# Altium project DiscreteOpAmp.PrjPcb
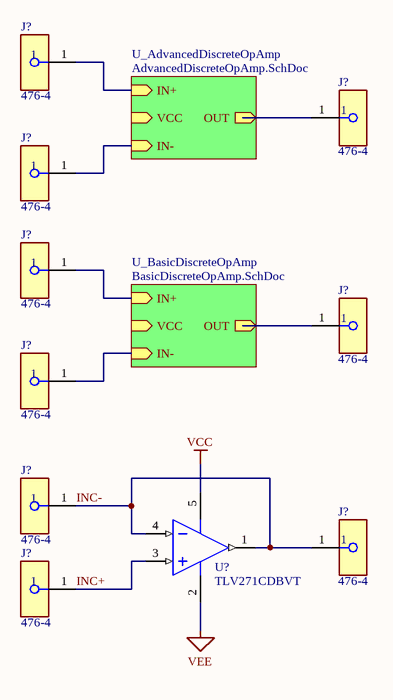
[diagram p0: main.SchDoc]
4 sheets, 40 parts. Net scope: hierarchical (ports join the sheet entries above them; power ports are global).
Board file: PCB1.PcbDoc
Sheets:
  main.SchDoc
    U_AdvancedDiscreteOpAmp = AdvancedDiscreteOpAmp.SchDoc
    U_BasicDiscreteOpAmp = BasicDiscreteOpAmp.SchDoc
  LM741_Design.SchDoc

## Sheet main.SchDoc
size A4; SheetNumber: 1; SheetTotal: 4

### Parts
(Parts that share a designator on the sheet are numbered #1, #2 ... from top to bottom, then left to right.)
J?#1  476-4  [FP-476-4-MFG]
J?#2  476-4  [FP-476-4-MFG]
J?#3  476-4  [FP-476-4-MFG]
J?#4  476-4  [FP-476-4-MFG]
J?#5  476-4  [FP-476-4-MFG]
J?#6  476-4  [FP-476-4-MFG]
J?#7  476-4  [FP-476-4-MFG]
J?#8  476-4  [FP-476-4-MFG]
J?#9  476-4  [FP-476-4-MFG]
U?  TLV271CDBVT  [DBV0005A_L]

### Sub-sheets
U_AdvancedDiscreteOpAmp = AdvancedDiscreteOpAmp.SchDoc: IN- (in), IN+ (in), OUT (out), VCC (in)
U_BasicDiscreteOpAmp = BasicDiscreteOpAmp.SchDoc: OUT (out), IN- (in), IN+ (in), VCC (in)

### Nets
VCC: U?.5(VDD)
VEE: U?.2(GND)
IN+: J?#1.1 ; sheet U_AdvancedDiscreteOpAmp/IN+
IN-: J?#6.1 ; sheet U_BasicDiscreteOpAmp/IN-
IN-: J?#3.1 ; sheet U_AdvancedDiscreteOpAmp/IN-  [a separate net that carries the same name]
INA+: J?#4.1 ; sheet U_BasicDiscreteOpAmp/IN+
INC+: J?#9.1 U?.3(IN+)
INC-: J?#7.1 J?#8.1 U?.1(OUT) U?.4(IN-)
OUT: J?#2.1 ; sheet U_AdvancedDiscreteOpAmp/OUT
OUTA: J?#5.1 ; sheet U_BasicDiscreteOpAmp/OUT

### Library data of the parts
J?#1-J?#9 = CMP-19636-000003-1: PLUG JACK MINI NON-INSULATED; Manufacturer: Keystone Electronics; Is Female: yes; Number Of Contacts: 1; Current Rating: 10A; Conn Orientation: Straight; Device Class L1: Connectors; Category: Conn; ComponentLink2Description: Datasheet; Lead Free: Yes; Device Class L3: unset; Package: 476-4; RoHS: TRUE; Contact Material: Tin; Footprint Url: https://www.keyelco.com/product-pdf.cfm?p=2378; Mouser Description: Test Plugs & Test Jacks BANANA JACK NON-INSUL; Octopart: https://octopart.com/476-4-keystone-225161; Device Class L2: unset; Manufacturer Part Number: 476-4; ComponentLink2URL: https://www.keyelco.com/userAssets/file/M65p111.pdf; Digikey Description: PLUG JACK MINI NON-INSULATED; Automotive: No
U? = CMP-0272-02196-3: 550 uA/Ch, 3 MHz, Rail-to-Rail Output Operational Amplifier, 2.7 to 16 V, 0 to 70 degC, 5-pin SOT23 (DBV5), Green (RoHS & no Sb/Br); Manufacturer: Texas Instruments; Total Supply Voltage(Max)(+5V is 5, +/-5V is 10): 16; GBW(Typ)(MHz): 3; Offset Drift(Typ)(uV/C): 2; Rating: Catalog; Vio (25C)(Max)(mV): 5; Slew Rate(Typ)(V/us): 2.4; IIB(Max)(pA): 60; Packing: SMALL T&R; Total Supply Voltage(Min)(+5V is 5, +/-5V is 10): 2.7; Sub Family: Low Supply Voltage Amplifier (<=2.7V), Precision Amplifier; Iq per channel(Max)(mA): 0.66; Number of Channels: 1; CMRR(Min)(dB): 69; ComponentLink3Description: Package Specification; Code_JEDEC: MO-178; ComponentLink1Description: Manufacturer URL; Eco-Plan: Green (RoHS & no Sb/Br); PackageReference: DBV0005A; Mounting Technology: Surface Mount; ComponentLink1URL: http://www.ti.com/; ComponentLink2URL: http://www.ti.com/lit/ds/symlink/tlv271.pdf; PackageDescription: 5-Pin Plastic Small Outline, Body 1.6 x 2.9 mm, Pitch 0.95 mm; DatasheetVersion: SLOS351D; ComponentLink2Description: Datasheet; PartNumber: TLV271CDBVT; ComponentLink3URL: http://www.ti.com/litv/pdf/mpds018i; PackageVersion: 4073253-4/K, 03/2006

## Sheet AdvancedDiscreteOpAmp.SchDoc
size A4; SheetNumber: 3; SheetTotal: 4
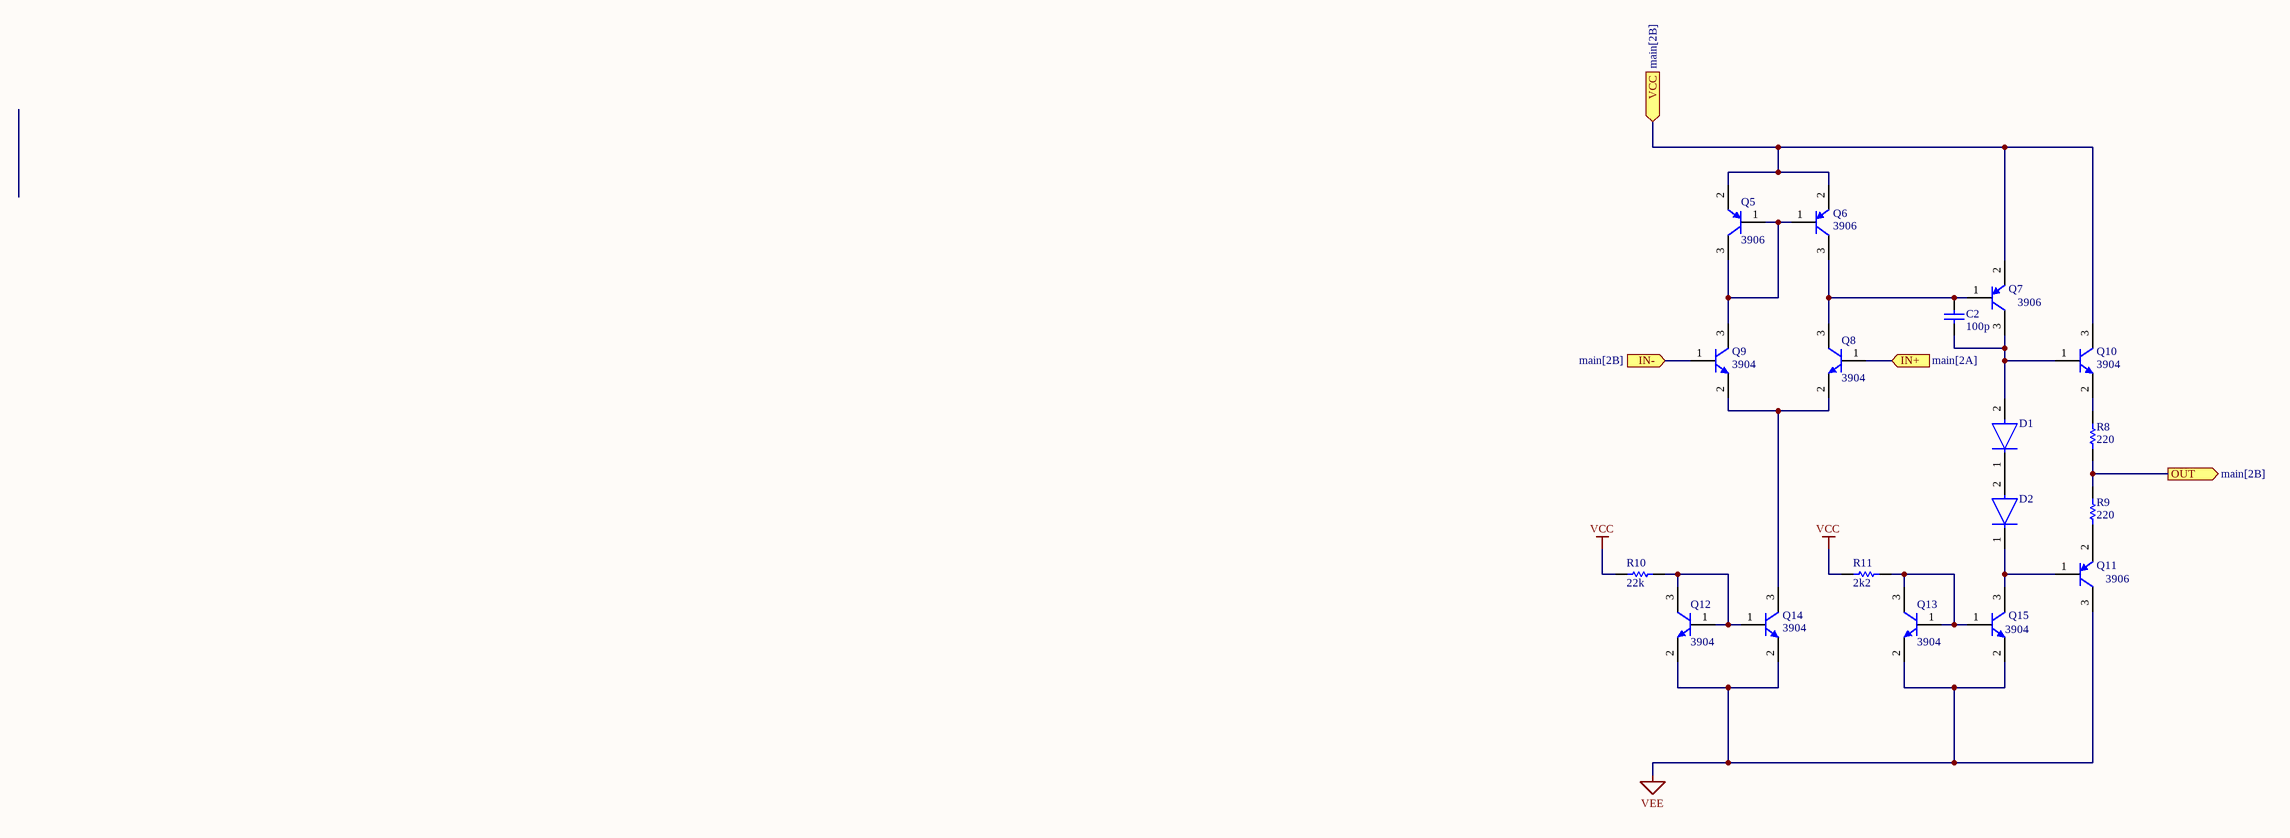
[diagram p1: AdvancedDiscreteOpAmp.SchDoc]

### Parts
C2  100p  [CAPC2013X145X48ML20T23]
D1  (no value)  [FP-96547-MFG]
D2  (no value)  [FP-96547-MFG]
Q5  3906  [ONSC-SOT-23-3-318-08_V]
Q6  3906  [ONSC-SOT-23-3-318-08_V]
Q7  3906  [ONSC-SOT-23-3-318-08_V]
Q8  3904  [ONSC-SOT-23-3-318-08_V]
Q9  3904  [ONSC-SOT-23-3-318-08_V]
Q10  3904  [ONSC-SOT-23-3-318-08_V]
Q11  3906  [ONSC-SOT-23-3-318-08_V]
Q12  3904  [ONSC-SOT-23-3-318-08_V]
Q13  3904  [ONSC-SOT-23-3-318-08_V]
Q14  3904  [ONSC-SOT-23-3-318-08_V]
Q15  3904  [ONSC-SOT-23-3-318-08_V]
R8  220  [RESC2013X50X30ML20T20]
R9  220  [RESC2013X50X30ML20T20]
R10  22k  [RESC2013X50X30ML20T20]
R11  2k2  [RESC2013X50X30ML20T20]

### Ports
IN+ (in, see main[2A]), IN- (in, see main[2B]), OUT (out, see main[2B]), VCC (in, see main[2B])

### Nets
VCC: R10.2 R11.2
VEE: Q11.3(C) Q12.2(E) Q13.2(E) Q14.2(E) Q15.2(E)
IN+: Q8.1(B) ; port IN+
IN-: Q9.1(B) ; port IN-
OUT: R8.1 R9.2 ; port OUT
VCC: Q5.2(E) Q6.2(E) Q7.2(E) Q10.3(C) ; port VCC  [a separate net that carries the same name]
NetC2_1: C2.1 D1.2(A) Q7.3(C) Q10.1(B)
NetC2_2: C2.2 Q6.3(C) Q7.1(B) Q8.3(C)
NetD1_1: D1.1(C) D2.2(A)
NetD2_1: D2.1(C) Q11.1(B) Q15.3(C)
NetQ5_1: Q5.1(B) Q5.3(C) Q6.1(B) Q9.3(C)
NetQ8_2: Q8.2(E) Q9.2(E) Q14.3(C)
NetQ10_2: Q10.2(E) R8.2
NetQ11_2: Q11.2(E) R9.1
NetQ12_1: Q12.1(B) Q12.3(C) Q14.1(B) R10.1
NetQ13_1: Q13.1(B) Q13.3(C) Q15.1(B) R11.1

### Library data of the parts
C2 = CMP-2007-01701-1: Manufacturer: Vitramon; Part Number: VJ0805A101KXAAC
D1 D2 = CMP-02540-000039-1: DIODE AVALANCHE 1KV 1.5A DO220; Manufacturer Part Number: AS1PM-M3/84A; Manufacturer: Vishay; Automotive Grade: Grade 0; Peak Reverse Current: 0.3uA; Value: 10.4pF; Max Junction Temp: +175°C; Max Repetitive Reverse Voltage: 1000V; Max Surge Forward Current: 30A; Package: 96547; Forward Current: 1.5A; Automotive: Yes; Octopart: https://octopart.com/as1pm-m3%2F84a-vishay-44629776; Mouser Description: AS1PM-M3/84A; SMT Avalanche Diode; 1000V 1.5A; 1.5us; 2-Pin DO-220AA; Temperature Range High: +175°C; RoHS: TRUE; Lead Free: Yes; Temperature Range Low: -55°C; Device Class L3: Rectifier Diodes; Temperature: -55°C to +175°C; ComponentLink2URL: https://www.vishay.com/docs/89290/as1pm.pdf; Device Class L2: Diodes; Footprint Url: https://www.vishay.com/docs/96547/smp_do-220aa.pdf; Device Class L1: Discrete Semiconductors; Digikey Description: DIODE AVALANCHE 1KV 1.5A DO220; Capacitance: 10.4pF; Height: 1.15mm; ComponentLink2Description: Datasheet; Category: Diode
Q5-Q7 Q11 = CMP-1048-00670-1: General Purpose Transistor, PNP Silicon, 3-Pin SOT-23, Pb-Free, Tape and Reel; PartNumber: MMBT3906LT1G; Manufacturer: On Semiconductor; IC Continuous (A): -0.2; fT Min (MHz): 250; PackageDescription: 3-Pin Small Outline Transistor, Body 2.92 x 1.3 mm, Pitch 0.95 mm; Packing: Tape and Reel; ComponentLink3Description: Package Specification; Mounting Technology: Surface Mount; ComponentLink3URL: http://www.onsemi.cn/pub_link/Collateral/318-08.PDF; ComponentLink1URL: http://www.onsemi.com/; ComponentLink2URL: http://www.onsemi.cn/pub_link/Collateral/MMBT3906LT1-D.PDF; PackageReference: SOT-23-3-318-08; Polarity: PNP; ComponentLink2Description: Datasheet; PackageVersion: Rev. AP, 11/2009; RoHS: TRUE; DatasheetVersion: Rev. 11; ComponentLink1Description: Manufacturer URL
Q8-Q10 Q12-Q15 = CMP-1048-00630-1: General Purpose Transistor, NPN Silicon, 3-Pin SOT-23, Pb-Free, Tape and Reel; Manufacturer: On Semiconductor; PartNumber: MMBT3904LT3G; fT Min (MHz): 300; IC Continuous (A): 0.2; PackageVersion: Rev. AP, 11/2009; PackageReference: SOT-23-3-318-08; Packing: Tape and Reel; RoHS: TRUE; ComponentLink2Description: Datasheet; PackageDescription: 3-Pin Small Outline Transistor, Body 2.92 x 1.3 mm, Pitch 0.95 mm; ComponentLink1Description: Manufacturer URL; ComponentLink3URL: http://www.onsemi.cn/pub_link/Collateral/318-08.PDF; Mounting Technology: Surface Mount; ComponentLink3Description: Package Specification; DatasheetVersion: Rev. 12; ComponentLink1URL: http://www.onsemi.com/; ComponentLink2URL: http://www.onsemi.cn/pub_link/Collateral/MMBT3904LT1-D.PDF; Polarity: NPN
R8-R11 = CMP-2001-03596-1: Part Number: CRCW08051K00FKEB; Manufacturer: Vishay Dale

## Sheet BasicDiscreteOpAmp.SchDoc
size A4; SheetNumber: 2; SheetTotal: 4
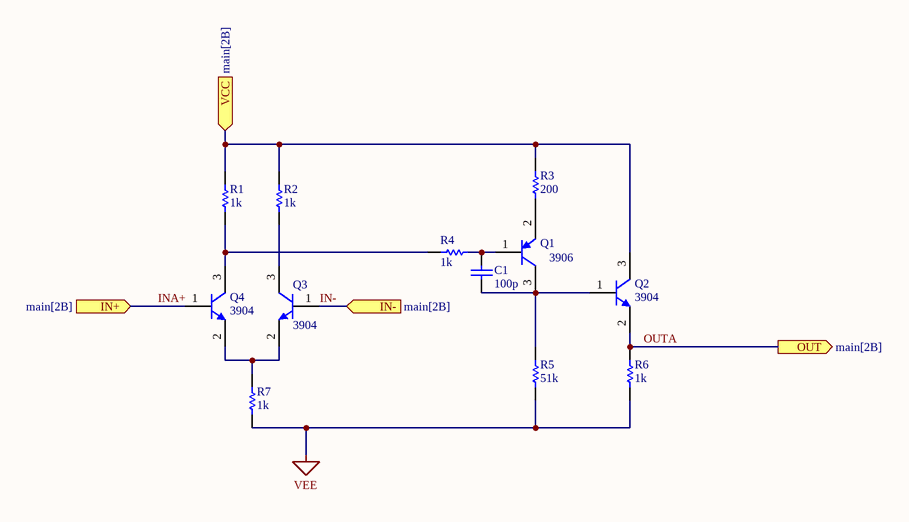
[diagram p2: BasicDiscreteOpAmp.SchDoc]

### Parts
C1  100p  [CAPC2013X145X48ML20T23]
Q1  3906  [ONSC-SOT-23-3-318-08_V]
Q2  3904  [ONSC-SOT-23-3-318-08_V]
Q3  3904  [ONSC-SOT-23-3-318-08_V]
Q4  3904  [ONSC-SOT-23-3-318-08_V]
R1  1k  [RESC2013X50X30ML20T20]
R2  1k  [RESC2013X50X30ML20T20]
R3  200  [RESC2013X50X30ML20T20]
R4  1k  [RESC2013X50X30ML20T20]
R5  51k  [RESC2013X50X30ML20T20]
R6  1k  [RESC2013X50X30ML20T20]
R7  1k  [RESC2013X50X30ML20T20]

### Ports
IN+ (in, see main[2B]), IN- (in, see main[2B]), OUT (out, see main[2B]), VCC (in, see main[2B])

### Nets
VEE: R5.1 R6.1 R7.1
IN-: Q3.1(B) ; port IN-
INA+: Q4.1(B) ; port IN+
OUTA: Q2.2(E) R6.2 ; port OUT
VCC: Q2.3(C) R1.2 R2.2 R3.2 ; port VCC
NetC1_1: C1.1 Q1.3(C) Q2.1(B) R5.2
NetC1_2: C1.2 Q1.1(B) R4.1
NetQ1_2: Q1.2(E) R3.1
NetQ3_2: Q3.2(E) Q4.2(E) R7.2
NetQ3_3: Q3.3(C) R2.1
NetQ4_3: Q4.3(C) R1.1 R4.2

### Library data of the parts
C1 = CMP-2007-01701-1: as C2 on sheet AdvancedDiscreteOpAmp
Q1 = CMP-1048-00670-1: as Q5 on sheet AdvancedDiscreteOpAmp; PackageDescription: 3-Pin Small Outline Transistor, Body 2.92 x 1.3 mm, Pitch 0.95 mm; Packing: Tape and Reel; ComponentLink3Description: Package Specification; Mounting Technology: Surface Mount; ComponentLink3URL: http://www.onsemi.cn/pub_link/Collateral/318-08.PDF; ComponentLink1URL: http://www.onsemi.com/; ComponentLink2URL: http://www.onsemi.cn/pub_link/Collateral/MMBT3906LT1-D.PDF; PackageReference: SOT-23-3-318-08; Polarity: PNP; ComponentLink2Description: Datasheet; PackageVersion: Rev. AP, 11/2009; RoHS: TRUE; DatasheetVersion: Rev. 11; ComponentLink1Description: Manufacturer URL
Q2-Q4 = CMP-1048-00630-1: as Q8 on sheet AdvancedDiscreteOpAmp; PackageVersion: Rev. AP, 11/2009; PackageReference: SOT-23-3-318-08; Packing: Tape and Reel; RoHS: TRUE; ComponentLink2Description: Datasheet; PackageDescription: 3-Pin Small Outline Transistor, Body 2.92 x 1.3 mm, Pitch 0.95 mm; ComponentLink1Description: Manufacturer URL; ComponentLink3URL: http://www.onsemi.cn/pub_link/Collateral/318-08.PDF; Mounting Technology: Surface Mount; ComponentLink3Description: Package Specification; DatasheetVersion: Rev. 12; ComponentLink1URL: http://www.onsemi.com/; ComponentLink2URL: http://www.onsemi.cn/pub_link/Collateral/MMBT3904LT1-D.PDF; Polarity: NPN
R1-R7 = CMP-2001-03596-1: as R8 on sheet AdvancedDiscreteOpAmp

## Sheet LM741_Design.SchDoc
size A4; SheetNumber: 4; SheetTotal: 4
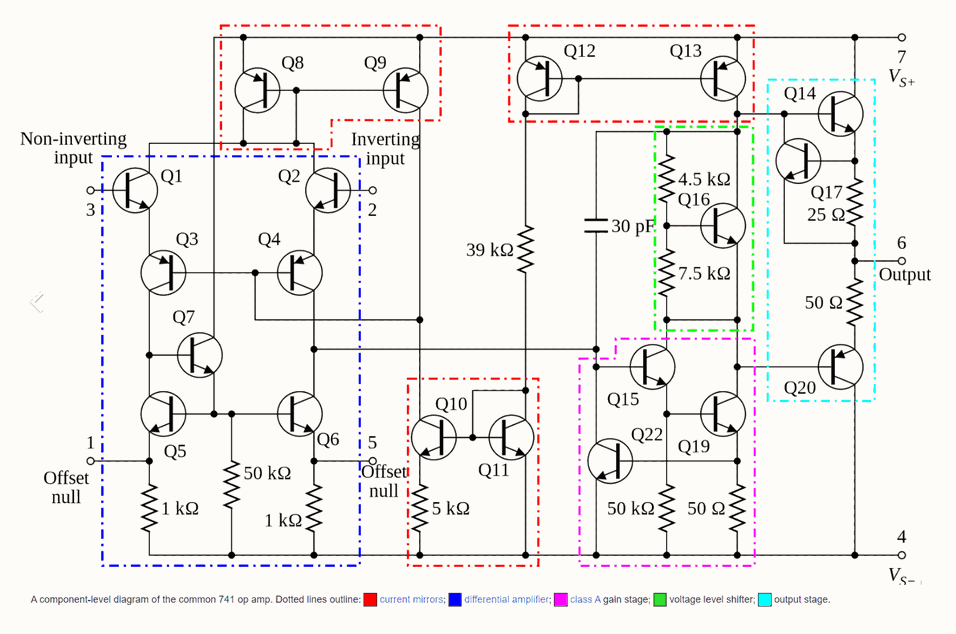
[diagram p3: LM741_Design.SchDoc]

## Nets that join several sheets
VCC: main (U?.5), AdvancedDiscreteOpAmp (R10.2 R11.2)
VEE: main (U?.2), AdvancedDiscreteOpAmp (5 pins), BasicDiscreteOpAmp (R5.1 R6.1 R7.1)
IN+: main (J?#1.1), AdvancedDiscreteOpAmp (Q8.1)
IN-: main (J?#6.1), BasicDiscreteOpAmp (Q3.1)
IN-: main (J?#3.1), AdvancedDiscreteOpAmp (Q9.1)
INA+: main (J?#4.1), BasicDiscreteOpAmp (Q4.1)
OUT: main (J?#2.1), AdvancedDiscreteOpAmp (R8.1 R9.2)
OUTA: main (J?#5.1), BasicDiscreteOpAmp (Q2.2 R6.2)